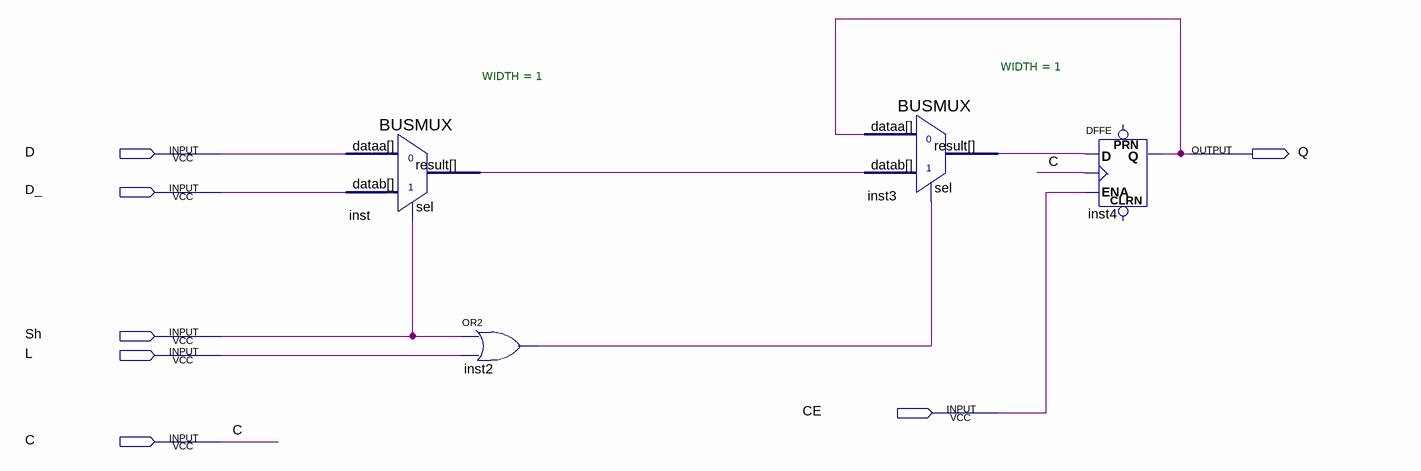
[diagram p0: schematic sheet]
// Quartus schematic REGEB.bdf as structural Verilog: 4 symbols, 7 pins
module REGEB (
  input  D,
  input  D_,
  input  Sh,
  input  L,
  input  CE,
  input  C,
  output Q
);

  wire inst2_out, inst3_result, inst_result;

  BUSMUX #(.WIDTH(1)) inst (.datab(D_), .sel(Sh), .dataa(D), .result(inst_result));
  or inst2 (inst2_out, Sh, L);
  BUSMUX #(.WIDTH(1)) inst3 (.datab(inst_result), .sel(inst2_out), .dataa(Q), .result(inst3_result));
  DFFE inst4 (.D(inst3_result), .CLK(C), .ENA(CE), .Q(Q));  // open: PRN, CLRN
endmodule
